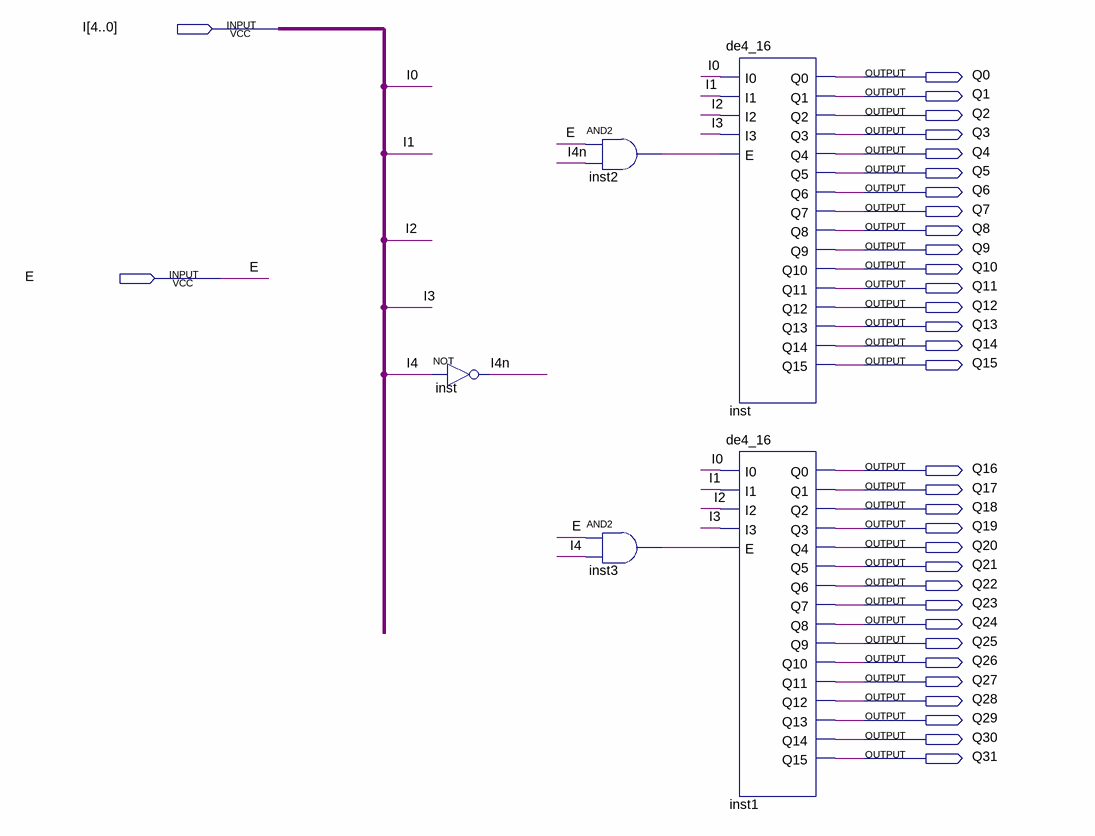
[diagram p0: schematic sheet]
// Quartus schematic de5_32.bdf as structural Verilog: 5 symbols, 34 pins
module de5_32 (
  input  [4:0] I,
  input  E,
  output Q0,
  output Q1,
  output Q2,
  output Q3,
  output Q4,
  output Q5,
  output Q6,
  output Q7,
  output Q8,
  output Q9,
  output Q10,
  output Q11,
  output Q12,
  output Q13,
  output Q14,
  output Q15,
  output Q16,
  output Q17,
  output Q18,
  output Q19,
  output Q20,
  output Q21,
  output Q22,
  output Q23,
  output Q24,
  output Q25,
  output Q26,
  output Q27,
  output Q28,
  output Q29,
  output Q30,
  output Q31
);

  wire I4n, inst2_out, inst3_out;

  not inst (I4n, I[4]);
  and inst2 (inst2_out, E, I4n);
  and inst3 (inst3_out, E, I[4]);
  de4_16 inst_dup2 (
    .I0(I[0]), .I1(I[1]), .I2(I[2]), .I3(I[3]), .E(inst2_out), .Q0(Q0), .Q1(Q1), .Q2(Q2), .Q3(Q3), .Q4(Q4),
    .Q5(Q5), .Q6(Q6), .Q7(Q7), .Q8(Q8), .Q9(Q9), .Q10(Q10), .Q11(Q11), .Q12(Q12), .Q13(Q13), .Q14(Q14),
    .Q15(Q15));
  de4_16 inst1 (
    .I0(I[0]), .I1(I[1]), .I2(I[2]), .I3(I[3]), .E(inst3_out), .Q0(Q16), .Q1(Q17), .Q2(Q18), .Q3(Q19),
    .Q4(Q20), .Q5(Q21), .Q6(Q22), .Q7(Q23), .Q8(Q24), .Q9(Q25), .Q10(Q26), .Q11(Q27), .Q12(Q28), .Q13(Q29),
    .Q14(Q30), .Q15(Q31));
endmodule
